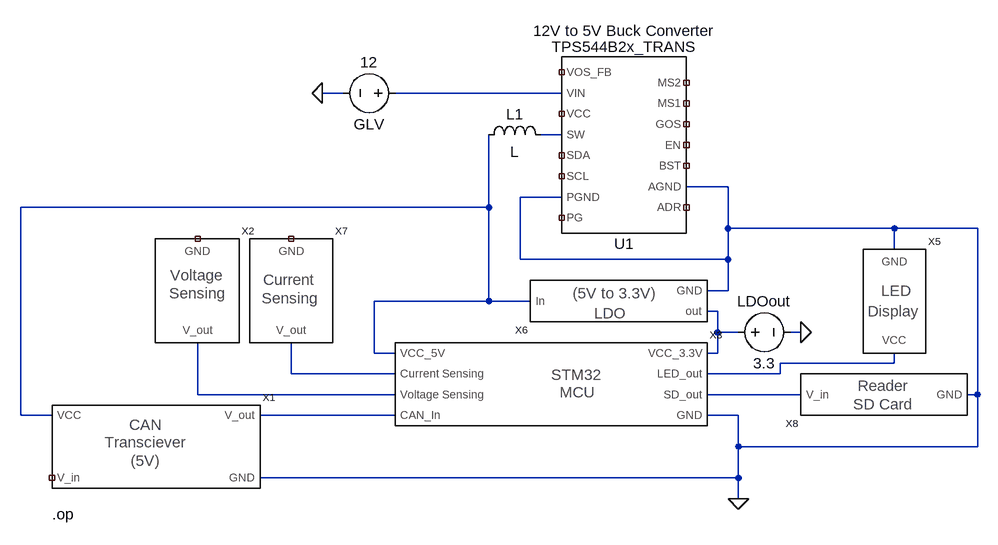
[diagram p0: schematic Fuller_LTSpice.asc]
Fuller_LTSpice.asc, the LTspice schematic file:
Version 4.1
SHEET 1 1308 680
WIRE -16 -272 -48 -272
WIRE 320 -272 64 -272
WIRE 320 -208 288 -208
WIRE 576 -128 512 -128
WIRE 320 -112 256 -112
WIRE 208 -96 208 -208
WIRE 208 -96 -512 -96
WIRE 576 -64 576 -128
WIRE 832 -64 576 -64
WIRE 960 -64 832 -64
WIRE 832 -32 832 -64
WIRE 256 -16 256 -112
WIRE 576 -16 576 -64
WIRE 576 -16 256 -16
WIRE 576 32 576 -16
WIRE 576 32 544 32
WIRE 208 48 208 -96
WIRE 208 48 32 48
WIRE 272 48 208 48
WIRE 560 64 544 64
WIRE 560 96 560 64
WIRE 592 96 560 96
WIRE 688 96 672 96
WIRE 32 128 32 48
WIRE 64 128 32 128
WIRE 560 128 560 96
WIRE 560 128 544 128
WIRE 832 144 832 128
WIRE 832 144 656 144
WIRE -96 160 -96 112
WIRE 64 160 -96 160
WIRE 656 160 656 144
WIRE 656 160 544 160
WIRE -240 192 -240 112
WIRE 64 192 -240 192
WIRE 688 192 544 192
WIRE 960 192 960 -64
WIRE 960 192 944 192
WIRE -512 224 -512 -96
WIRE -464 224 -512 224
WIRE 64 224 -144 224
WIRE 592 224 544 224
WIRE 592 272 592 224
WIRE 960 272 960 192
WIRE 960 272 592 272
WIRE 592 320 592 272
WIRE 592 320 -144 320
WIRE 592 352 592 320
FLAG 592 352 0
FLAG -48 -272 0
FLAG 688 96 0
SYMBOL CANTransc_CUSTOM -336 272 R0
SYMATTR InstName X1
SYMBOL TPS544B2x_TRANS 416 -192 R180
SYMATTR InstName U1
SYMATTR SpiceLine 12V to 5V Buck Converter
SYMBOL voltageSensing_CUSTOM -240 96 R0
SYMATTR InstName X2
SYMBOL STM32_MCU_CUSTOM 224 176 R0
SYMATTR InstName X3
SYMBOL LEDdisplay_CUSTOM 832 64 R0
SYMATTR InstName X5
SYMBOL LDO_5Vto3x3V_CUSTOM 400 48 R180
SYMATTR InstName X6
SYMBOL currentSensing_CUSTOM -96 32 R0
SYMATTR InstName X7
SYMBOL SDcard_Reader_CUSTOM 816 192 R180
SYMATTR InstName X8
SYMBOL voltage 80 -272 R90
WINDOW 0 32 56 VTop 2
WINDOW 3 -32 56 VBottom 2
WINDOW 123 0 0 Left 0
WINDOW 39 0 0 Left 0
SYMATTR InstName GLV
SYMATTR Value 12
SYMBOL ind 192 -192 R270
WINDOW 0 32 56 VTop 2
WINDOW 3 5 56 VBottom 2
SYMATTR InstName L1
SYMBOL voltage 576 96 R270
WINDOW 0 32 56 VTop 2
WINDOW 3 -32 56 VBottom 2
WINDOW 123 0 0 Left 0
WINDOW 39 0 0 Left 0
SYMATTR InstName LDOout
SYMATTR Value 3.3
TEXT -464 376 Left 2 !.op

The netlist it stands for:
* Fuller_LTSpice.asc
X§X1 N003 NC_01 N009 0 CANTransc_CUSTOM  ; pins VCC V_in V_out GND
X§U1 NC_02 0 NC_03 NC_04 NC_05 NC_06 NC_07 NC_08 0 NC_09 NC_10 N002 NC_11 N001 NC_12 TPS544B2x_TRANS 12V to 5V Buck Converter  ; pins ADR AGND BST EN GOS MS1 MS2 PG PGND SCL SDA SW VCC VIN VOS_FB
X§X2 N007 NC_13 voltageSensing_CUSTOM  ; pins V_out GND
X§X3 N004 N003 N006 N007 N009 N005 N008 0 STM32_MCU_CUSTOM  ; pins VCC_3.3V VCC_5V Current_Sensing Voltage_Sensing CAN_In LED_out SD_out GND
X§X5 N005 0 LEDdisplay_CUSTOM  ; pins VCC GND
X§X6 N003 N004 0 LDO_5Vto3x3V_CUSTOM  ; pins In out GND
X§X7 N006 NC_14 currentSensing_CUSTOM  ; pins V_out GND
X§X8 N008 0 SDcard_Reader_CUSTOM  ; pins V_in GND
V§GLV N001 0 12
L1 N003 N002 L
V§LDOout N004 0 3.3
.op
.lib TPS544B2x_TRANS.lib
.backanno
.end